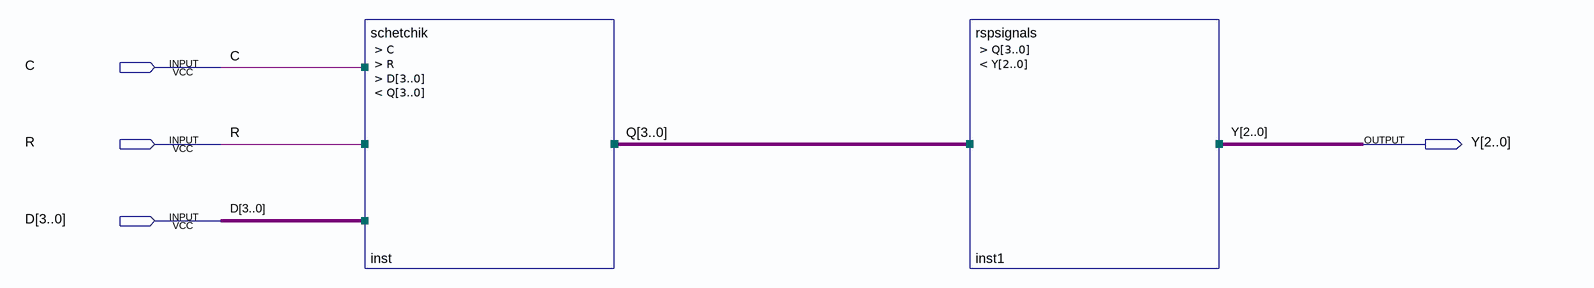
[diagram p0: schematic sheet]
// Quartus schematic lab1.bdf as structural Verilog: 2 symbols, 4 pins
module lab1 (
  input  C,
  input  R,
  input  [3:0] D,
  output [2:0] Y
);

  wire [3:0] Q;

  schetchik inst (.C(C), .R(R), .D(D), .Q(Q));
  rspsignals inst1 (.Q(Q), .Y(Y));
endmodule
